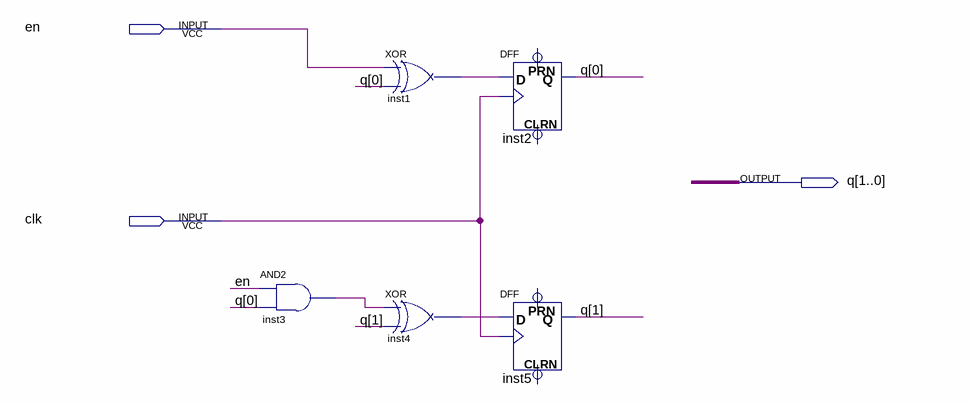
[diagram p0: schematic sheet]
// Quartus schematic counter.bdf as structural Verilog: 5 symbols, 3 pins
module counter (
  input  en,
  input  clk,
  output [1:0] q
);

  wire inst1_out, inst3_out, inst4_out;

  and inst3 (inst3_out, en, q[0]);
  xor inst1 (inst1_out, en, q[0]);
  xor inst4 (inst4_out, inst3_out, q[1]);
  DFF inst2 (.CLK(clk), .D(inst1_out), .Q(q[0]));  // open: CLRN, PRN
  DFF inst5 (.CLK(clk), .D(inst4_out), .Q(q[1]));  // open: CLRN, PRN
endmodule
